# Altium schematic sheet MCU.SchDoc
size A4; SheetNumber: 1; SheetTotal: 4
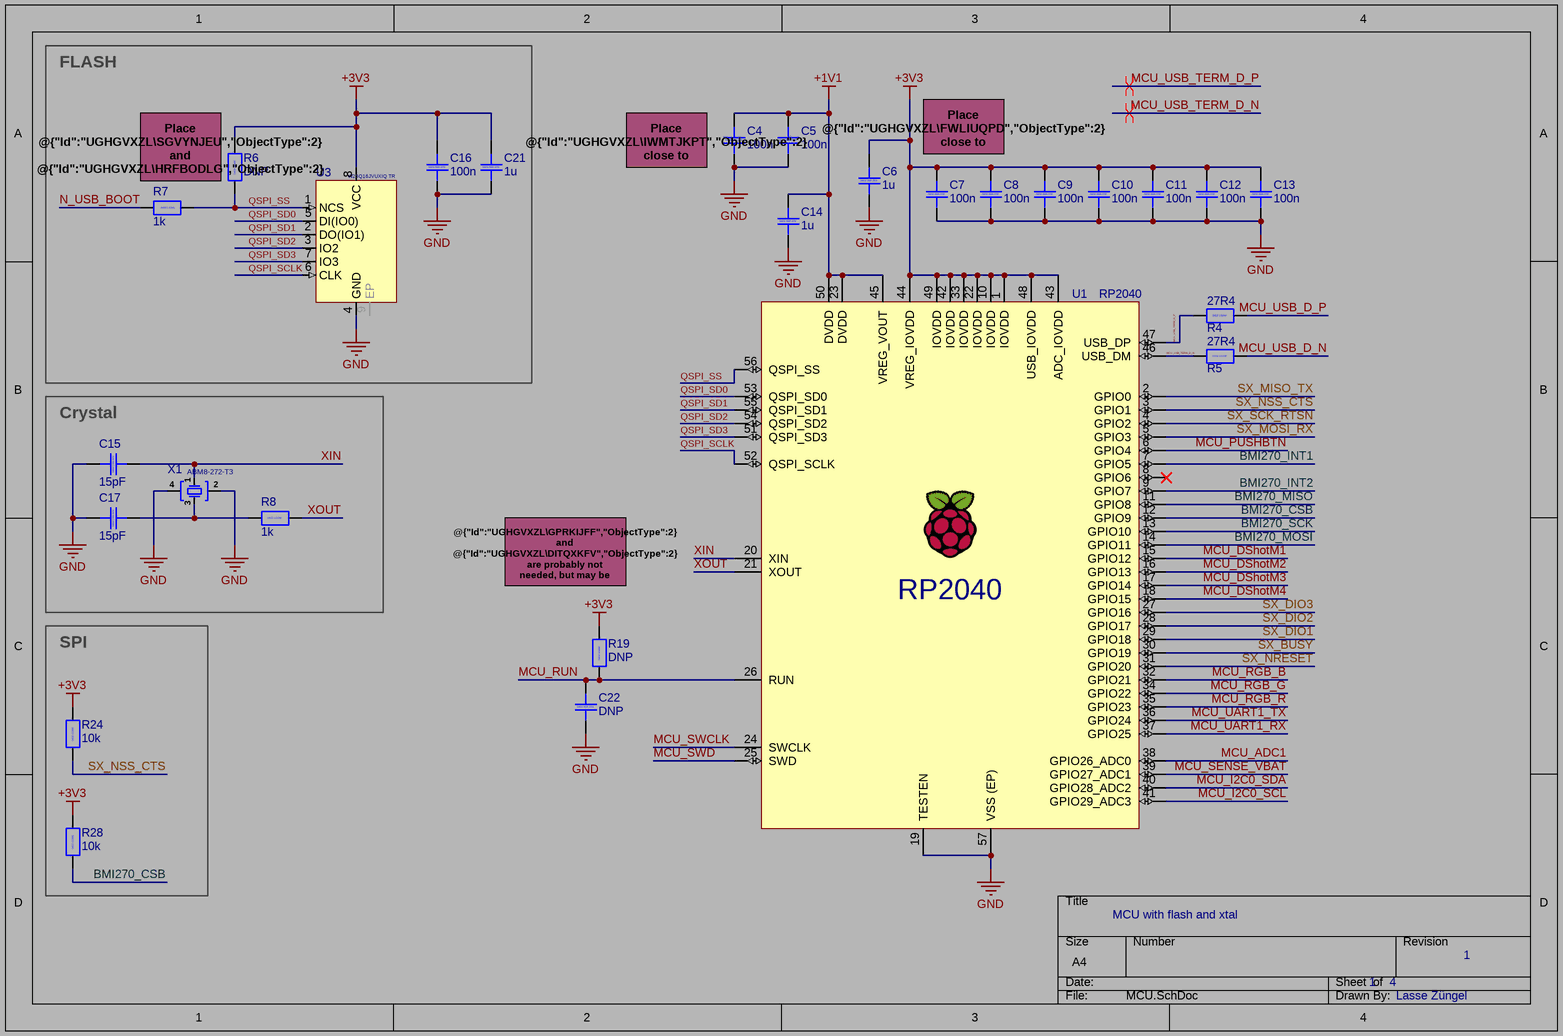
[diagram p0: MCU.SchDoc]

## Parts
C4  100n  [CAP_0402]
C5  100n  [CAP_0402]
C6  1u  [CAP_0402]
C7  100n  [CAP_0402]
C8  100n  [CAP_0402]
C9  100n  [CAP_0402]
C10  100n  [CAP_0402]
C11  100n  [CAP_0402]
C12  100n  [CAP_0402]
C13  100n  [CAP_0402]
C14  1u  [CAP_0402]
C15  15pF  [CAP_0402]
C16  100n  [CAP_0402]
C17  15pF  [CAP_0402]
C21  1u  [CAP_0402]
C22  DNP  [CAP_0402]
R4  27R4  [RES_0402]
R5  27R4  [RES_0402]
R6  DNP  [RES_0402]
R7  1k  [RES_0402]
R8  1k  [RES_0402]
R19  DNP  [RES_0402]
R24  10k  [RES_0402]
R28  10k  [RES_0402]
U1  RP2040  [QFN56 7x7 RP2040]
U3  W25Q16JVUXIQ TR  [USON-8 - 2x3]
X1  ABM8-272-T3  [ABM8-272-T3]

## Blocks framed on the sheet
FLASH: C16 C21 R6 R7 U3
Crystal: C15 C17 R8 X1
SPI: R24 R28

## Nets
+1V1: C4.2 C5.2 C14.2 U1.23(DVDD) U1.45(VREG_VOUT) U1.50(DVDD)
+3V3: C6.2 C7.2 C8.2 C9.2 C10.2 C11.2 C12.2 C13.2 C16.2 C21.2 R6.2 R19.2 R24.2 R28.2 U1.1(IOVDD) U1.10(IOVDD) U1.22(IOVDD) U1.33(IOVDD) U1.42(IOVDD) U1.43(ADC_IOVDD) U1.44(VREG_IOVDD) U1.48(USB_IOVDD) U1.49(IOVDD) U3.8(VCC)
GND: C4.1 C5.1 C6.1 C7.1 C8.1 C9.1 C10.1 C11.1 C12.1 C13.1 C14.1 C15.2 C16.1 C17.2 C21.1 C22.1 U1.19(TESTEN) U1.57(VSS_(EP)) U3.4(GND) X1.2 X1.4
BMI270_CSB: R28.1 U1.12(GPIO9)
BMI270_INT1: U1.7(GPIO5)
BMI270_INT2: U1.9(GPIO7)
BMI270_MISO: U1.11(GPIO8)
BMI270_MOSI: U1.14(GPIO11)
BMI270_SCK: U1.13(GPIO10)
MCU_ADC1: U1.38(GPIO26_ADC0)
MCU_DShotM1: U1.15(GPIO12)
MCU_DShotM2: U1.16(GPIO13)
MCU_DShotM3: U1.17(GPIO14)
MCU_DShotM4: U1.18(GPIO15)
MCU_I2C0_SCL: U1.41(GPIO29_ADC3)
MCU_I2C0_SDA: U1.40(GPIO28_ADC2)
MCU_PUSHBTN: U1.6(GPIO4)
MCU_RGB_B: U1.32(GPIO21)
MCU_RGB_G: U1.34(GPIO22)
MCU_RGB_R: U1.35(GPIO23)
MCU_RUN: C22.2 R19.1 U1.26(RUN)
MCU_SENSE_VBAT: U1.39(GPIO27_ADC1)
MCU_SWCLK: U1.24(SWCLK)
MCU_SWD: U1.25(SWD)
MCU_UART1_RX: U1.37(GPIO25)
MCU_UART1_TX: U1.36(GPIO24)
MCU_USB_D_N: R5.2
MCU_USB_D_P: R4.2
MCU_USB_TERM_D_N: R5.1 U1.46(USB_DM)
MCU_USB_TERM_D_P: R4.1 U1.47(USB_DP)
N_USB_BOOT: R7.2
QSPI_SCLK: U1.52(QSPI_SCLK) U3.6(CLK)
QSPI_SD0: U1.53(QSPI_SD0) U3.5(DI(IO0))
QSPI_SD1: U1.55(QSPI_SD1) U3.2(DO(IO1))
QSPI_SD2: U1.54(QSPI_SD2) U3.3(IO2)
QSPI_SD3: U1.51(QSPI_SD3) U3.7(IO3)
QSPI_SS: R6.1 R7.1 U1.56(QSPI_SS) U3.1(NCS)
SX_BUSY: U1.30(GPIO19)
SX_DIO1: U1.29(GPIO18)
SX_DIO2: U1.28(GPIO17)
SX_DIO3: U1.27(GPIO16)
SX_MISO_TX: U1.2(GPIO0)
SX_MOSI_RX: U1.5(GPIO3)
SX_NRESET: U1.31(GPIO20)
SX_NSS_CTS: R24.1 U1.3(GPIO1)
SX_SCK_RTSN: U1.4(GPIO2)
XIN: C15.1 U1.20(XIN) X1.1
XOUT: R8.2 U1.21(XOUT)
NetC17_1: C17.1 R8.1 X1.3

Not connected (* = marked no-connect by the designer): U1 8(GPIO6)*; U3 9(EP)

## Layout directives
differential pair; differential pair class DIFFPAIRUSBMCU: MCU_USB_TERM_D_N, MCU_USB_TERM_D_P

## Notes on the sheet
- (near R6) Place @{"Id":"UGHGVXZL\SGVYNJEU","ObjectType":2} and @{"Id":"UGHGVXZL\HRFBODLG","ObjectType":2} close to @{"Id":"UGHGVXZL\OZXAQZFD","ObjectType":2} pin 1.
- (near C4) Place @{"Id":"UGHGVXZL\IWMTJKPT","ObjectType":2} close to @{"Id":"UGHGVXZL\TVPMBQHX","ObjectType":2} pin 45.
- Place @{"Id":"UGHGVXZL\FWLIUQPD","ObjectType":2} close to @{"Id":"UGHGVXZL\TVPMBQHX","ObjectType":2} pin 44.
- @{"Id":"UGHGVXZL\GPRKIJFF","ObjectType":2} and @{"Id":"UGHGVXZL\DITQXKFV","ObjectType":2} are probably not needed, but may be added in case of spurrious resets.
- MCU with flash and xtal
- 1    4
- 1
- Lasse Züngel
- (in symbol CAP_0402_C0G_50V) 0402 C0G 50V
- (in symbol CAP_0402_X5R_25V) 0402 X5R 25V
- (in symbol RES_0402) 0402 1/16W

## Library data of the parts
C4-C14 C16 C21 C22 = CAP_0402_X5R_25V: Capacitor 0402 generic, X5R, 25V
C15 C17 = CAP_0402_C0G_50V: Capacitor 0402 generic, C0G (NP0), 50V
R4-R8 R19 R24 R28 = RES_0402: Resistor 0402 generic, 1/16W
U1 = RP2040: SC0914(13) / ARM Microcontrollers - MCU IC RP2040 (RP2B2) T&R, 3,400 (13" reel) UICC01104
U3 = W25Q16JVUXIQ TR: FLASH - NOR Memory IC 16Mbit SPI - Quad I/O 133 MHz 6 ns 8-USON (2x3)
X1 = ABM8-272-T3: Crystals Ultra Miniature Ceramic SMD Crystal / 12MHz 10pF 30PPM 3.2mm x 2.5mm 50R; ComponentLink1Description: Datasheet; ComponentLink1URL: https://www.mouser.de/datasheet/2/122/ECX_1637B-1633271.pdf; ComponentLink2Description: Product Detail; ComponentLink2URL: https://eu.mouser.com/ProductDetail/ECS/ECS-320-8-37B-CKY-TR?qs=l7cgNqFNU1jF5E15eCxZkA%3D%3D